# EasyEDA Pro project SciOly_EV_Controller_v1.epro, board PCB1
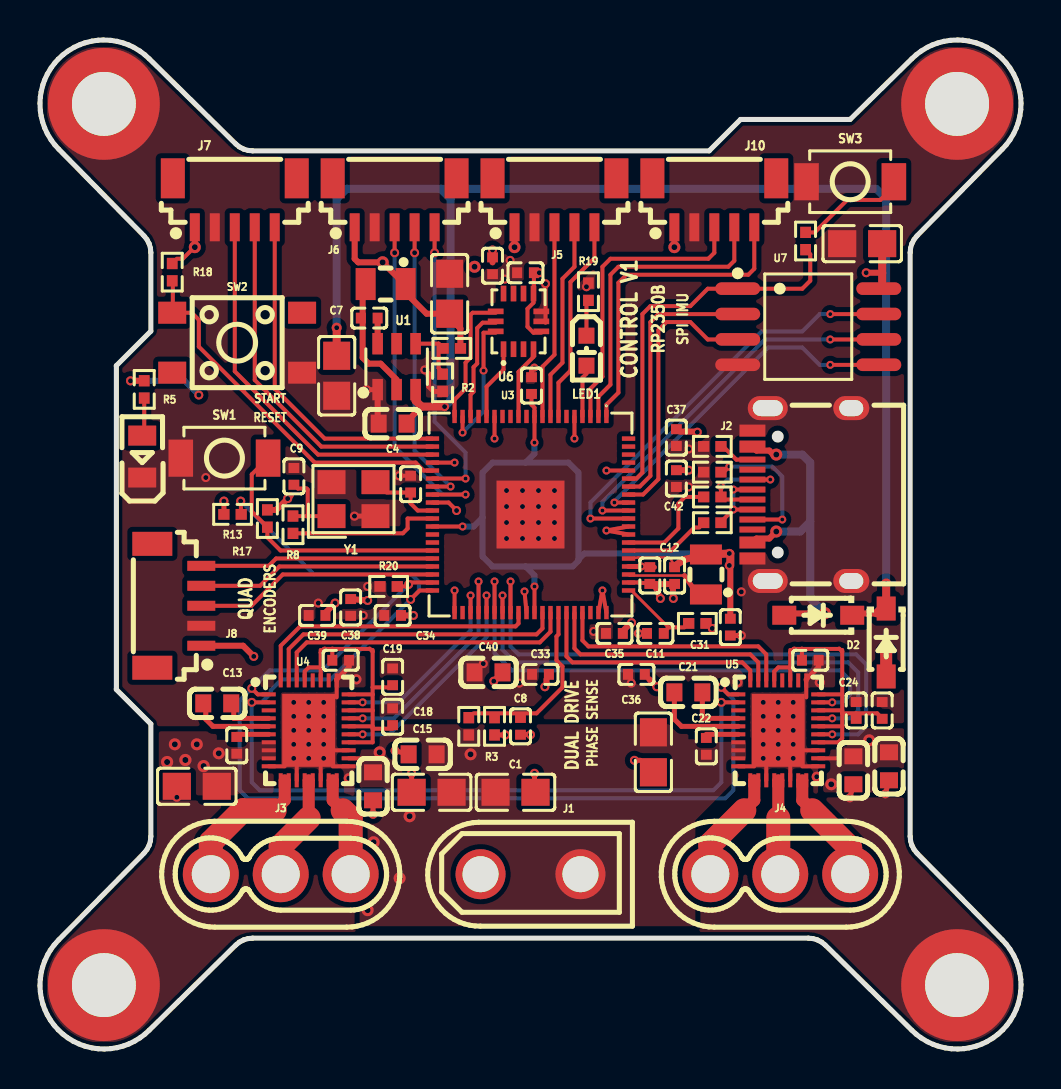
[diagram p4: board, top side]
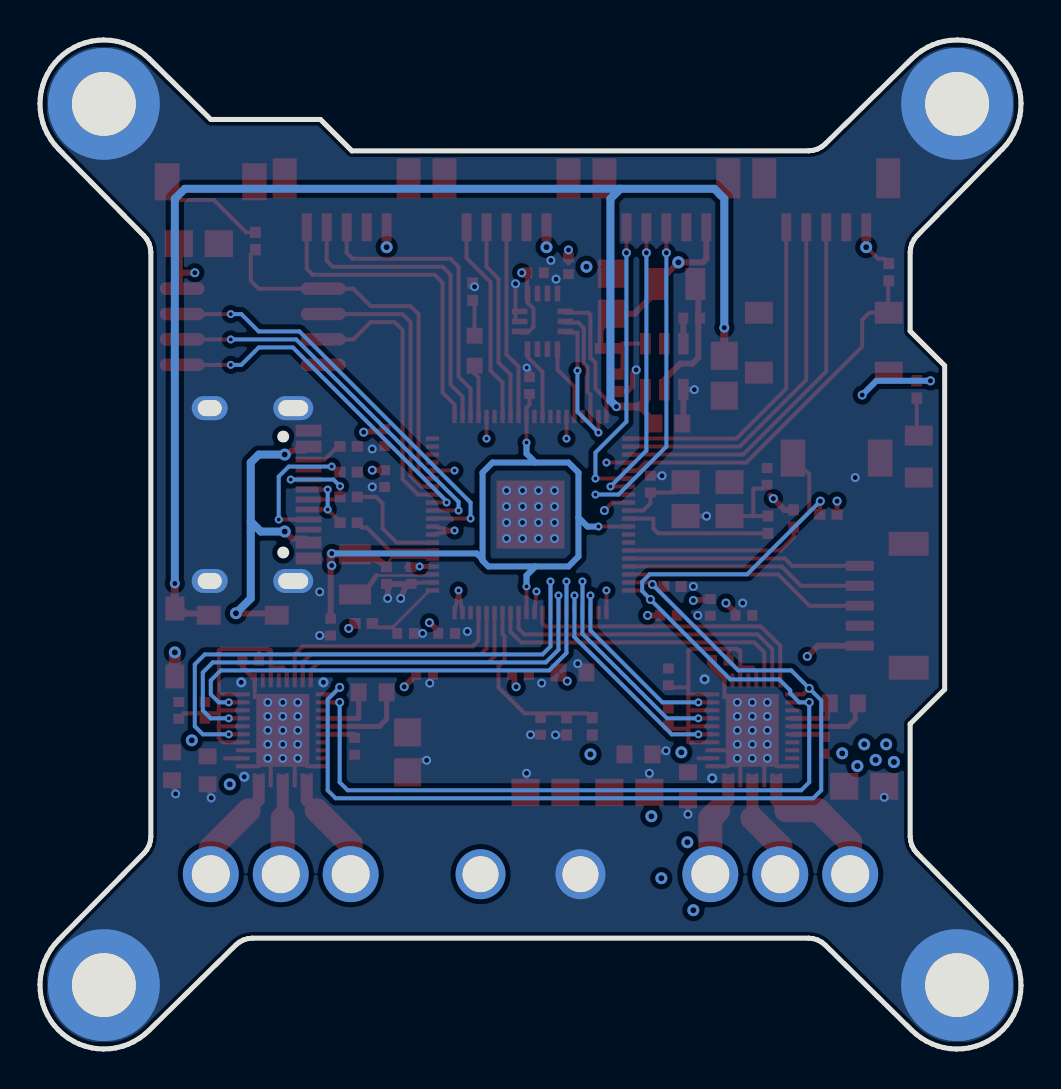
[diagram p5: board, bottom side, seen from below]

Outline 49.1 x 50.5 mm; copper layers: Top Layer, GND_L2, VBAT_SIG, Bottom Layer. Coordinates in mm from the lower left corner of the outline.
Outline path: 0,47.33 0.02,47.64 0.06,47.89 0.15,48.26 0.23,48.5 0.36,48.78 0.56,49.1 0.75,49.35 0.92,49.54 1.15,49.75 1.4,49.94 1.72,50.13 2,50.27 2.24,50.35 2.6,50.44 2.92,50.49 3.17,50.5 3.54,50.48 3.85,50.43 4.16,50.35 4.45,50.24 4.68,50.13 5,49.94 5.25,49.75 5.47,49.55 9.8,45.29 9.98,45.15 10.19,45.04 10.41,44.97 10.64,44.95 33.49,44.95 35.06,46.52 40.54,46.52 43.63,49.55 43.85,49.75 44.1,49.94 44.42,50.13 44.65,50.24 44.94,50.35 45.25,50.43 45.56,50.48 45.93,50.5 46.18,50.49 46.49,50.44 46.86,50.35 47.15,50.24 47.38,50.13 47.7,49.94 47.95,49.75 48.14,49.58 48.35,49.35 48.54,49.1 48.73,48.78 48.87,48.5 48.95,48.26 49.04,47.89 49.09,47.58 49.1,47.33 49.09,47.02 49.04,46.7 48.95,46.34 48.87,46.1 48.73,45.82 48.54,45.5 48.35,45.25 48.15,45.03 43.89,40.7 43.75,40.52 43.64,40.31 43.57,40.09 43.55,39.86 43.55,10.64 43.57,10.41 43.64,10.19 43.75,9.98 43.89,9.8 48.15,5.47 48.35,5.25 48.54,5 48.73,4.68 48.87,4.4 48.95,4.16 49.04,3.79 49.09,3.48 49.1,3.23 49.09,2.92 49.04,2.6 48.95,2.24 48.87,2 48.73,1.72 48.54,1.4 48.39,1.19 48.18,0.96 47.95,0.75 47.7,0.56 47.38,0.36 47.15,0.26 46.86,0.15 46.49,0.06 46.24,0.02 45.93,0 45.62,0.01 45.3,0.06 44.94,0.15 44.7,0.23 44.42,0.36 44.1,0.56 43.85,0.75 43.63,0.95 39.3,5.2 39.12,5.35 38.91,5.46 38.69,5.53 38.46,5.55 10.64,5.55 10.41,5.53 10.19,5.46 9.98,5.35 9.8,5.2 5.47,0.95 5.25,0.75 5,0.56 4.73,0.39 4.45,0.26 4.16,0.15 3.85,0.07 3.54,0.02 3.23,0 2.92,0.01 2.6,0.06 2.24,0.15 1.95,0.26 1.67,0.39 1.4,0.56 1.15,0.75 0.92,0.96 0.71,1.19 0.52,1.45 0.36,1.72 0.26,1.95 0.15,2.24 0.07,2.55 0.02,2.86 0,3.17 0.01,3.48 0.07,3.85 0.13,4.1 0.23,4.4 0.39,4.73 0.52,4.95 0.71,5.21 0.95,5.47 5.2,9.8 5.35,9.98 5.46,10.19 5.53,10.41 5.55,10.64 5.55,16.27 3.82,18 3.82,34.2 5.55,35.93 5.55,39.86 5.53,40.09 5.46,40.31 5.35,40.52 5.2,40.7 0.95,45.03 0.75,45.25 0.56,45.5 0.36,45.82 0.23,46.1 0.13,46.4 0.06,46.7 0.02,46.96 0,47.33
Stack: Top Layer 0.035mm / Dielectric1 1.51mm FR4 er 4.5 / Bottom Layer 0.035mm

## Design rules (mm)
spacing copperThickness1oz (default): track to track 0.1, other pairs 0.1 to 0.3
spacing copperThickness2oz: track to track 0.203, other pairs 0.152 to 0.3
track width copperThickness1oz (default): min 0.1, default 0.2, max 5
track width copperThickness2oz: min 0.203, default 0.254, max 2.54
differential pair differentialPair (default): width min 0.127, default 0.254, max 2.54; gap min 0.152, default 0.152

## Placement (name value [footprint] x y rotation side)
C1  22uF  [C0805]  23.8 12.85 0 top
C2  10uF  [C0805]  19.6 12.85 0 top
C3  10uF  [C0805]  14.85 33.69 90 top
C4  100nF  [C0603]  17.65 31.3 0 top
C5  22uF  [C0805]  20.5 37.8 270 top
C6  22uF  [C0805]  41.15 40.3 0 top
C7  100nF  [C0402]  16.48 36.58 180 top
C8  100nF  [C0402]  24.05 16.15 90 top
C9  15pF  [C0402]  12.71 28.66 270 top
C10  15pF  [C0402]  18.55 28.27 270 top
C11  4.7uF  [C0402]  30.8 20.8 0 top
C12  4.7uF  [C0402]  31.76 23.7 90 top
C13  100nF  [C0603]  8.87 17.3 180 top
C14  1uF  [C0402]  9.85 15.2 270 top
C15  100nF  [C0603]  19.15 14.75 0 top
C16  100nF  [C0603]  16.67 13.15 90 top
C17  10uF  [C0805]  7.85 13.15 0 top
C18  4.7uF  [C0402]  17.65 16.63 90 top
C19  100nF  [C0402]  17.65 18.63 90 top
C21  100nF  [C0603]  32.45 17.85 180 top
C22  1uF  [C0402]  33.35 15.15 270 top
C24  4.7uF  [C0402]  40.85 16.95 90 top
C25  100nF  [C0402]  42.15 16.95 90 top
C26  10uF  [C0805]  30.7 14.85 90 top
C27  100nF  [C0603]  42.49 14.15 90 top
C28  100nF  [C0603]  40.71 13.95 90 top
C29  100nF  [C0402]  24.3 38.85 0 top
C30  100nF  [C0402]  22.65 39.2 90 top
C31  4.7uF  [C0402]  34.55 21.11 90 top
C32  100nF  [C0402]  24.6 33.2 270 top
C33  100nF  [C0402]  25.05 18.75 0 top
C34  100nF  [C0402]  17.65 21.7 0 top
C35  100nF  [C0402]  28.75 20.8 0 top
C36  100nF  [C0402]  29.85 18.75 0 top
C37  100nF  [C0402]  31.85 30.6 90 top
C38  100nF  [C0402]  15.55 22.1 90 top
C39  100nF  [C0402]  13.87 21.7 0 top
C40  10uF  [C0603]  22.45 18.85 0 top
C41  4.7uF  [C0402]  30.52 23.7 90 top
C42  100nF  [C0402]  31.85 28.55 90 top
C43  100nF  [C0402]  15.05 19.46 0 top
C44  100nF  [C0402]  38.55 19.46 0 top
D2  B5819W SL  [SOD-123_L2.7-W1.6-LS3.7-RD-1]  42.35 20.35 270 top
D3  B5819W SL  [SOD-123_L2.7-W1.6-LS3.7-RD-1]  38.95 21.71 180 top
D4  KT-0805G  [LED0805-R-RD]  5.12 29.65 90 top
J1  XT30UPB-M  [CONN-TH_XT30UPB-M]  24.55 8.75 0 top
J2  TYPE-C-31-M-12  [USB-C_SMD-TYPE-C-31-M-12_1]  38.13 27.75 90 top
J3  MR30PB-M.G2.Y  [CONN-TH_MR30PB-M]  12.05 8.75 0 top
J4  MR30PB-M.G2.Y  [CONN-TH_MR30PB-M]  37.05 8.75 0 top
J5  ZX-SH1.0-5PLT  [CONN-SMD_5P-P1.00_ZX-SH1.0-5PLT]  25.75 42.35 0 top
J6  ZX-SH1.0-5PLT  [CONN-SMD_5P-P1.00_ZX-SH1.0-5PLT]  17.75 42.35 0 top
J7  ZX-SH1.0-5PLT  [CONN-SMD_5P-P1.00_ZX-SH1.0-5PLT]  9.75 42.35 0 top
J8  ZX-SH1.0-5PLT  [CONN-SMD_5P-P1.00_ZX-SH1.0-5PLT]  6.85 22.18 90 top
J10  ZX-SH1.0-5PLT  [CONN-SMD_5P-P1.00_ZX-SH1.0-5PLT]  33.75 42.35 0 top
L1  3.3uH  [IND-SMD_L2.0-W1.6_AOTA-B201610S3R3-101-T]  17.3 38.28 0 top
L2  3.3uH  [IND-SMD_L2.0-W1.6_AOTA-B201610S3R3-101-T]  33.33 23.75 270 top
LED1  KT-0603R  [LED-SMD_L1.6-W0.8-R-RD]  27.35 34.95 270 top
NOREF  -  [Pad_e342]  3.2 3.2 0 top
NOREF#2  -  [Pad_e341]  3.2 47.3 0 top
NOREF#3  -  [Pad_e340]  45.9 47.3 0 top
NOREF#4  -  [Pad_e339]  45.9 3.2 0 top
R1  100kΩ  [R0402]  20.61 35.06 0 top
R2  22kΩ  [R0402]  20.15 33.34 90 top
R3  100kΩ  [R0402]  21.46 16.15 270 top
R4  22kΩ  [R0402]  22.75 16.15 90 top
R5  1kΩ  [R0402]  5.22 33.01 90 top
R6  5.1kΩ  [R0402]  33.65 28.87 0 top
R7  5.1kΩ  [R0402]  33.65 30.16 0 top
R8  1kΩ  [R0402]  12.66 26.24 90 top
R9  33Ω  [R0402]  32.9 21.3 0 top
R10  1kΩ  [R0402]  38.31 40.44 270 top
R11  22Ω  [R0402]  33.65 26.34 180 top
R13  10kΩ  [R0402]  9.64 26.76 0 top
R16  22Ω  [R0402]  33.65 27.63 180 top
R17  10kΩ  [R0402]  11.38 26.55 90 top
R18  10kΩ  [R0402]  6.62 38.88 90 top
R19  1kΩ  [R0402]  27.45 37.9 270 top
R20  100kΩ  [R0402]  17.45 23.15 180 top
SW1  TS-1088-AR02016  [SW-SMD_L3.9-W3.0-P4.45]  9.23 29.57 0 top
SW2  KH-4.5X4.5X10H-SMT  [SW-SMD_4P-L4.5-W4.5-P3.00-LS6.8]  9.87 35.35 0 top
SW3  TS-1088-AR02016  [SW-SMD_L3.9-W3.0-P4.45]  40.55 43.4 0 top
U1  TPS54202DDCR  [SOT-23-6_L2.9-W1.6-P0.95-LS2.8-BL]  17.85 34.15 0 top
U3  RP2350B  [QFN-80_L10.0-W10.0-P0.40-TL-EP3.4]  24.55 26.75 270 top
U4  DRV8317HREER  [QFN-36_L5.0-W4.0-P0.40-BL-EP]  13.45 15.95 270 top
U5  DRV8317HREER  [QFN-36_L5.0-W4.0-P0.40-BL-EP]  36.95 15.95 270 top
U6  ICM-42688-P(TOKMAS)  [LGA-14_L3.0-W2.5-P0.50-BL]  23.95 36.42 0 top
U7  W25Q128JVSIQ  [SOIC-8_L5.3-W5.3-P1.27-LS8.0-BL]  38.45 36.15 270 top
Y1  12MHz  [CRYSTAL-SMD_4P-L3.2-W2.5-BL]  15.69 27.52 0 top

## Footprints (pads in the part's own frame, mm; a bottom-side part is the same pattern mirrored in y, then rotated)
C0402
  rect 0.5x0.54 smd: 1(-0.42,0) 2(0.42,0)
C0603
  rect 0.8x0.9 smd: 1(-0.7,0) 2(0.7,0)
C0805
  rect 1.41x1.35 smd: 1(-1,0) 2(1,0)
CONN-SMD_5P-P1.00_ZX-SH1.0-5PLT
  rect 0.5x1.4 smd: 1(-2,-1.225) 2(-1,-1.225) 3(0,-1.225) 4(1,-1.225) 5(2,-1.225)
  rect 1.2x2 smd: 6(3.1,1.225) 7(-3.1,1.225)
CONN-TH_MR30PB-M
  round 2.8 hole 1.9: 1(-3.5,0) 2(0,0) 3(3.5,0)
CONN-TH_XT30UPB-M
  round 2.5 hole 1.8: 1(-2.5,0) 2(2.5,0)
CRYSTAL-SMD_4P-L3.2-W2.5-BL
  rect 1.4x1.2 smd: 1(-1.1,-0.85) 2(1.1,-0.85) 3(1.1,0.85) 4(-1.1,0.85)
IND-SMD_L2.0-W1.6_AOTA-B201610S3R3-101-T
  rect 1x1.6 smd: 1(-1,0) 2(1,0)
LED0805-R-RD
  rect 1x1.399 smd: 1(1.05,0) 2(-1.05,0)
LED-SMD_L1.6-W0.8-R-RD
  rect 0.8x0.8 smd: 1(0.75,0) 2(-0.75,0)
LGA-14_L3.0-W2.5-P0.50-BL
  rect 0.28x0.785 smd: 1(-0.75,-1.393) 2(-0.25,-1.393) 3(0.25,-1.393) 4(0.75,-1.393) 8(0.75,1.393) 9(0.25,1.393) 10(-0.25,1.393) 11(-0.75,1.393)
  rect 0.785x0.28 smd: 5(1.143,-0.5) 6(1.143,0) 7(1.143,0.5) 12(-1.143,0.5) 13(-1.143,0) 14(-1.143,-0.5)
Pad_e339
  round 5.601 hole 3.2: MH1(0,0)
Pad_e340
  round 5.601 hole 3.2: MH2(0,0)
Pad_e341
  round 5.601 hole 3.2: MH3(0,0)
Pad_e342
  round 5.601 hole 3.2: MH4(0,0)
QFN-36_L5.0-W4.0-P0.40-BL-EP
  rect 0.2x0.7 smd: 1(-1.8,-2) 2(-1.4,-2) 3(-1,-2) 4(-0.6,-2) 5(-0.2,-2) 6(0.2,-2) 7(0.6,-2) 8(1,-2) 9(1.4,-2) 10(1.8,-2) 19(1.8,2) 20(1.4,2) 21(1,2) 22(0.6,2) 23(0.2,2) 24(-0.2,2) 25(-0.6,2) 26(-1,2) 27(-1.4,2) 28(-1.8,2)
  rect 0.7x0.2 smd: 11(2.5,-1.4) 12(2.5,-1) 13(2.5,-0.6) 14(2.5,-0.2) 15(2.5,0.2) 16(2.5,0.6) 17(2.5,1) 18(2.5,1.4) 29(-2.5,1.4) 30(-2.5,1) 31(-2.5,0.6) 32(-2.5,0.2) 33(-2.5,-0.2) 34(-2.5,-0.6) 35(-2.5,-1) 36(-2.5,-1.4)
  rect 3.65x2.65 smd: 37(0,0)
QFN-80_L10.0-W10.0-P0.40-TL-EP3.4
  rect 0.665x0.22 smd: 1(-4.907,3.8) 2(-4.907,3.4) 3(-4.907,3) 4(-4.907,2.6) 5(-4.907,2.2) 6(-4.907,1.8) 7(-4.907,1.4) 8(-4.907,1) 9(-4.907,0.6) 10(-4.907,0.2) 11(-4.907,-0.2) 12(-4.907,-0.6) 13(-4.907,-1) 14(-4.907,-1.4) 15(-4.907,-1.8) 16(-4.907,-2.2) 17(-4.907,-2.6) 18(-4.907,-3) 19(-4.907,-3.4) 20(-4.907,-3.8) 41(4.907,-3.8) 42(4.907,-3.4) 43(4.907,-3) 44(4.907,-2.6) 45(4.907,-2.2) 46(4.907,-1.8) 47(4.907,-1.4) 48(4.907,-1) 49(4.907,-0.6) 50(4.907,-0.2) 51(4.907,0.2) 52(4.907,0.6) 53(4.907,1) 54(4.907,1.4) 55(4.907,1.8) 56(4.907,2.2) 57(4.907,2.6) 58(4.907,3) 59(4.907,3.4) 60(4.907,3.8)
  rect 0.22x0.665 smd: 21(-3.8,-4.907) 22(-3.4,-4.907) 23(-3,-4.907) 24(-2.6,-4.907) 25(-2.2,-4.907) 26(-1.8,-4.907) 27(-1.4,-4.907) 28(-1,-4.907) 29(-0.6,-4.907) 30(-0.2,-4.907) 31(0.2,-4.907) 32(0.6,-4.907) 33(1,-4.907) 34(1.4,-4.907) 35(1.8,-4.907) 36(2.2,-4.907) 37(2.6,-4.907) 38(3,-4.907) 39(3.4,-4.907) 40(3.8,-4.907) 61(3.8,4.907) 62(3.4,4.907) 63(3,4.907) 64(2.6,4.907) 65(2.2,4.907) 66(1.8,4.907) 67(1.4,4.907) 68(1,4.907) 69(0.6,4.907) 70(0.2,4.907) 71(-0.2,4.907) 72(-0.6,4.907) 73(-1,4.907) 74(-1.4,4.907) 75(-1.8,4.907) 76(-2.2,4.907) 77(-2.6,4.907) 78(-3,4.907) 79(-3.4,4.907) 80(-3.8,4.907)
  rect 3.4x3.4 smd: 81(0,0)
R0402
  rect 0.566x0.54 smd: 1(-0.433,0) 2(0.433,0)
SOD-123_L2.7-W1.6-LS3.7-RD-1
  rect 1.2x0.95 smd: 1(-1.7,0) 2(1.7,0)
SOIC-8_L5.3-W5.3-P1.27-LS8.0-BL
  oval 0.63x2.25 smd: 1(-1.905,-3.53) 2(-0.635,-3.53) 3(0.635,-3.53) 4(1.905,-3.53) 5(1.905,3.53) 6(0.635,3.53) 7(-0.635,3.53) 8(-1.905,3.53)
SOT-23-6_L2.9-W1.6-P0.95-LS2.8-BL
  rect 0.532x1.072 smd: 1(-0.95,-1.149) 2(0,-1.149) 3(0.95,-1.149) 4(0.95,1.149) 5(0,1.149) 6(-0.95,1.149)
SW-SMD_4P-L4.5-W4.5-P3.00-LS6.8
  rect 1.4x1.1 smd: 1(-3.25,1.5) 2(3.25,1.5) 3(-3.25,-1.5) 4(3.25,-1.5)
SW-SMD_L3.9-W3.0-P4.45
  rect 1.23x1.86 smd: 1(-2.185,0) 2(2.185,0)
USB-C_SMD-TYPE-C-31-M-12_1
  oval 1.2x2 hole 0.8x1.5: 1(4.325,1.706) 4(-4.325,1.706)
  oval 1.2x1.8 hole 0.8x1.2: 2(4.325,-2.474) 3(-4.325,-2.474)
  custom 0.6x1.3 smd: A1B12(-3.2,2.474) A4B9(-2.4,2.474) B1A12(3.2,2.474) B4A9(2.401,2.474)
  rect 0.3x1.3 smd: A5(-1.25,2.474) A6(-0.25,2.474) A7(0.25,2.474) A8(1.25,2.474) B5(1.75,2.474) B6(0.75,2.474) B7(-0.75,2.474) B8(-1.75,2.474)

## Nets
As in the schematic, except:
GND: C1.2 C2.1 C3.1 C4.1 C5.1 C6.1 C8.1 C9.1 C10.1 C11.1 C12.1 C15.1 C16.1 C17.1 C18.2 C19.2 C24.2 C25.2 C26.1 C27.1 C28.1 C29.1 C30.1 C31.1 C32.1 C33.1 C34.1 C35.1 C36.1 C37.1 C38.1 C39.1 C40.1 C41.1 C42.1 C43.2 C44.2 D4.2 J1.1 J2.1 J2.2 J2.3 J2.4 J2.A1B12 J2.B1A12 J5.2 J6.2 J7.2 J8.2 J10.2 NOREF.MH4 NOREF#2.MH3 NOREF#3.MH2 NOREF#4.MH1 R2.1 R4.1 R6.1 R7.1 R19.1 R20.2 SW1.1 SW2.4 SW3.1 U1.1 U3.62 U3.81 U4.10 U4.13 U4.16 U4.19 U4.21 U4.29 U4.37 U5.10 U5.13 U5.16 U5.19 U5.21 U5.29 U5.37 U6.6 U6.7 U7.4 Y1.2 Y1.4

Pads without a net: J2 A8 B8; J5 6 7; J6 6 7; J7 6 7; J8 6 7; J10 6 7; SW2 2 3; U1 5; U3 6 11 13 14 17 33 34 42 58 77 78 79 80; U4 3 30 32; U5 3 30 32; U6 2 3 9 10 11

## Via types
v1: diameter 0.45, hole 0.25, Top Layer to Bottom Layer, 102 vias
v2: diameter 0.508, hole 0.254, Top Layer to Bottom Layer, 5 vias
v3: diameter 0.457, hole 0.254, Top Layer to Bottom Layer, 7 vias
v4: diameter 0.406, hole 0.203, Top Layer to Bottom Layer, 1 via
v5: diameter 0.6, hole 0.3, Top Layer to Bottom Layer, 19 vias
v6: diameter 0.61, hole 0.305, Top Layer to Bottom Layer, 4 vias
v7: diameter 0.5, hole 0.25, Top Layer to Bottom Layer, 2 vias
v8: diameter 0.4, hole 0.2, Top Layer to Bottom Layer, 41 vias
v9: diameter 0.46, hole 0.25, Top Layer to Bottom Layer, 2 vias

## Routing (per net, layer and track width the routed paths; a pad name or vN(x,y) marks a point on that pad's centre or on a via; arc(x,y) is an arc through that point)
+1V1: length 44.2
  Top Layer w0.12: 31.67,24.35 31.5,24.6 29.95,24.6 29.46,24.55
  Top Layer w0.2: U3.32 v8(21.15,26.15) ; U3.10 v8(24.75,30.35) ; U3.51 v8(24.75,23.15) ; 24.6,32.83 24.6,32.25 24.75,32.1 24.75,31.66
  Top Layer w0.3: 34.55,24.2 C31.2
  Top Layer w0.35: 31.67,24.11 32.25,24.5 L2.1
  Top Layer w0.4: 34.55,24.2 34.55,24.8 L2.1
  Bottom Layer w0.3: 24.3,24.15 24.75,23.7 v8(24.75,23.15) ; 24.3,24.15 26.66,24.15 26.95,24.44 26.95,24.51 ; 24.3,24.15 22.65,24.15 22.15,24.65 22.15,26.6 ; 26.95,24.51 26.95,28.85 26.45,29.35 24.3,29.35 ; 26.95,24.51 27.24,24.8 34.55,24.8 ; v8(21.15,26.15) 21.7,26.15 22.15,26.6 ; 24.3,29.35 24.75,29.8 v8(24.75,30.35) ; 24.3,29.35 22.65,29.35 22.15,28.85 22.15,26.6
  vias: v9(34.5,24.8) v9(34.5,24.2)
+3V3: length 49.5
  Top Layer w0.2: v1(20.85,26.95) 20.45,27.35 19.64,27.35 ; U3.24 v8(20.75,29.35) ; 6.85,39.55 7.15,39.55 7.75,40.15 ; 29.46,28.95 v8(28.35,28.95) ; 24.7,37.74 24.7,37.35 24.4,37.05 24.4,36.15 24.7,35.85 25.09,35.85 ; U3.50 v8(24.25,22.9) ; 24.7,37.74 24.72,37.76 C29.2 ; U3.60 v8(28.15,22.95) U3.59 ; U3.5 v8(26.75,30.55) ; 29.46,26.15 v8(28.35,25.95) 29.46,25.75 ; U3.15 v8(22.75,30.55) ; U3.41 v8(20.75,22.95)
  Top Layer w0.25: 9.21,26.76 v3(9.21,27.42) ; 30.75,24.11 v8(30.1,24.15) 29.46,24.15 ; v1(33.65,21.05) 33.55,21.15
  Top Layer w0.299: 20.3,36.8 19.35,36.8 18.3,37.85
  Top Layer w0.3: 5.22,33.44 v3(4.53,33.44) ; v1(41.35,38.85) 42.15,38.85 ; 32.9,30.85 32.85,30.9 32.05,30.9 ; v5(7.75,40.13) 7.75,41.13 ; 15.75,41.13 15.75,39.55 15.93,39.37 v6(17.15,39.37) 17.97,38.55 ; 20.3,36.8 21.04,36.06 21.04,35.06 ; 8.08,20.18 10.17,20.18 v1(10.7,19.65) ; v1(14.77,22.32) 14.29,21.84 C39.2 ; 30.85,18.15 30.5,18.5 ; v1(22.65,39.99) C30.2 22.65,39.37 ; 25.25,18.15 25.35,18.25 25.35,18.5 ; C40.2 v1(22.71,18.41) ; 11.38,26.98 11.83,26.98 12.55,27.7 ; 31.75,41.13 v5(31.75,40.13) ; C42.2 v1(32.47,28.97) ; C38.2 v1(16.4,22.45) ; v1(24.99,38.85) C29.2 ; 23.75,41.13 v5(23.75,40.13) ; 29.6,21.35 29.25,21 ; C34.2 v1(18.69,21.7)
  Top Layer w0.4: C6.2 42.15,38.05
  Bottom Layer w0.3: v1(7.95,32.73) 7.24,33.44 v3(4.53,33.44)
  vias: v1(25.27,18.13) v1(29.61,21.34) v1(30.87,18.13) v1(32.9,30.87) v3(12.4,27.55) v5(21.75,39.15)
GND: length 29.3
  Top Layer w0.2: 30.75,23.27 29.95,23.35 29.46,23.35 ; U5.13 36.35,14.2 ; U4.16 14.05,14.2 ; C10.1 v3(17.97,28.69) ; U5.19 38.15,14.15 ; U4.19 14.65,14.15 ; U4.21 14.65,14.95 ; 25.3,36.35 v1(25.3,38.3) ; U5.29 38.35,17.6 ; U4.13 12.85,14.2 ; U4.10 12.25,14.15 ; U5.10 35.75,14.15 ; U4.29 14.85,17.6 ; U5.16 37.55,14.2 ; U5.21 38.15,14.95
  Top Layer w0.25: C31.1 v3(35.1,20.69) ; C27.1 v1(42.31,12.77) ; C44.2 38.97,19.12 38.35,18.5 U5.29 ; Y1.2 v3(15.74,26.67) ; 24.55,15.75 24.3,15.75 ; C16.1 v1(16.67,11.75) ; 22.75,15.72 v1(23.3,15.72) ; v1(29.95,20.8) 30.2,20.8 ; 20.15,32.91 19.7,32.91 19.45,33.16 19.45,33.8 19.25,34 ; C15.1 v1(17.77,14.93) ; 16.9,33 v1(16.35,33) ; C43.2 15.47,19.12 14.85,18.5 U4.29 ; v1(29.75,14.45) 30.05,14.45 ; v4(24.74,34.1) 24.6,33.96 24.6,33.67 ; v1(24.75,13.8) 24.75,13.5 ; C28.1 v1(40.53,12.57) ; 18.6,12.85 v1(18.6,13.8)
  Top Layer w0.3: v1(31.7,22.55) 31.67,23.27 30.75,23.27 v1(31.05,22.55) ; 16.9,33 16.9,31.7
  vias: v1(6.85,12.6) v1(8.3,28.6) v1(12.7,17.35) v1(12.7,16.65) v1(12.7,15.95) v1(12.7,15.25) v1(12.7,14.55) v1(13.45,17.35) v1(13.45,16.65) v1(13.45,15.95) v1(13.45,15.25) v1(13.45,14.55) v1(13.93,22.32) v1(14.2,17.35) v1(14.2,16.65) v1(14.2,15.95) v1(14.2,15.25) v1(14.2,14.55) v1(16.18,21.7) v1(16.4,23.15) v1(19.26,33.99) v1(22.19,19.29) v1(23.27,38.53) v1(23.35,27.95) v1(23.35,27.15) v1(23.35,26.35) v1(23.35,25.55) v1(23.53,39.47) v1(23.99,18.31) v1(24.15,27.95) v1(24.15,27.15) v1(24.15,26.35) v1(24.15,25.55) v1(24.55,15.73) v1(24.95,27.95) v1(24.95,27.15) v1(24.95,26.35) v1(24.95,25.55) v1(25.75,27.95) v1(25.75,27.15) v1(25.75,26.35) v1(25.75,25.55) v1(27.35,38.15) v1(27.71,20.9) v1(29.59,18.31) v1(32.47,30.03) v1(32.47,28.13) v1(35.1,22.88) v1(36.2,17.35) v1(36.2,16.65) v1(36.2,15.95) v1(36.2,15.25) v1(36.2,14.55) v1(36.95,17.35) v1(36.95,16.65) v1(36.95,15.95) v1(36.95,15.25) v1(36.95,14.55) v1(37.7,17.35) v1(37.7,16.65) v1(37.7,15.95) v1(37.7,15.25) v1(37.7,14.55) v2(15.46,13.55) v2(15.84,18.5) v2(34.91,18.35) v2(38.87,13.63) v2(39.03,18.35)
VBAT: length 2.5
  Top Layer w0.2: U4.20 16.15,14.55 ; U5.20 39.85,14.55
  Top Layer w0.6: 42.35,18.9 v5(42.35,19.85)
  vias: v5(6.75,15.25) v5(7.85,15.25) v5(8.95,14.8) v5(16.4,6.95) v5(16.7,10.35) v5(17,14.85) v5(18,8.55) v5(18.5,11.65) v5(21.55,14.75) v5(39.6,13.25) v5(41.5,15.45) v6(6.36,14.36) v6(7.28,14.46) v6(8.19,14.16)
VBAT_SENSE: length 8.6
  Top Layer w0.2: 25.95,21.55 25.95,20.75 25.85,20.65 25.85,19.45 26.15,19.15 26.15,18.1 24.85,16.8 21.7,16.8
VBUS: length 15.9
  Top Layer w0.3: v5(36.85,29.75) 36.7,29.75 36.5,29.95 35.86,29.95 35.66,30.15 ; v5(36.85,25.9) 36.5,25.55 35.86,25.55 35.66,25.35 ; 39.3,21.8 37.8,21.8
  Bottom Layer w0.4: v5(39.29,21.81) 38.55,22.55 38.55,26.4 ; 38.55,26.4 38.05,25.9 v5(36.85,25.9) ; 38.55,26.4 38.55,29.35 38.15,29.75 v5(36.85,29.75)
BUCK_SW: length 5.3
  Top Layer w0.3: 16.15,37.73 16.15,34.6 16.45,34.3 17.05,34.3 17.85,33.5
DRV1_AVDD: length 17.5
  Top Layer w0.2: 16.65,17.75 16.65,18.1 ; 16.65,17.75 16.65,16.95 ; 16.65,17.75 U4.28 ; 16.65,18.1 16.65,19.89 ; 16.65,18.1 17.45,18.1 ; U4.24 16.65,16.15 ; 16.65,16.15 16.65,16.95 ; 16.65,16.15 16.65,16.03 ; U4.22 16.65,15.35 16.65,16.03 ; 16.65,16.03 17.65,16.03 ; 16.65,19.89 16.5,20.04 ; 16.65,19.89 16.65,19.97 ; 16.65,16.95 U4.26 ; 14.63,20.02 C43.1 ; 14.63,20.02 14.23,20.02 ; 14.63,20.02 16.5,20.02 ; 14.63,20.02 14.63,20.04 ; U4.33 13.25,18.9 13.45,19.1 14.05,19.1 ; 14.23,20.02 14.25,20.04 ; 14.23,20.02 14.05,19.84 ; 14.23,20.02 14.2,20.02 ; 14.05,19.1 U4.31 ; 14.05,19.1 14.05,19.84 ; 14.05,19.84 14.05,19.97
DRV1_CP: length 1.6
  Top Layer w0.25: U4.6 9.85,15.75
DRV1_CPH: length 4.1
  Top Layer w0.25: 8.3,17.3 8.3,16.5 8.65,16.15 U4.5
DRV1_CPL: length 2.5
  Top Layer w0.25: 9.7,17.3 9.7,16.55 U4.4
DRV2_AVDD: length 17.9
  Top Layer w0.2: U5.33 36.75,18.9 36.95,19.1 37.55,19.1 ; 40,20.02 38.13,20.02 ; 38.13,20.02 37.73,20.02 ; 38.13,20.02 38.13,20.04 ; 38.13,20.02 C44.1 ; 37.73,20.02 37.75,20.04 ; 37.73,20.02 37.7,20.02 ; 37.73,20.02 37.55,19.84 ; U5.28 40.15,17.75 ; 40.15,17.75 40.15,19.89 ; 40.15,17.75 40.15,16.95 ; U5.24 40.15,16.15 ; 40.15,16.15 40.15,15.55 39.95,15.35 U5.22 ; 40.15,16.15 40.15,16.8 ; 40,20.04 40.15,19.89 ; 40.15,19.89 40.15,19.97 ; 42.15,16.55 41.9,16.8 40.85,16.8 ; 37.55,19.1 U5.31 ; 37.55,19.1 37.55,19.84 ; 40.15,16.8 40.15,16.95 ; 40.15,16.8 40.85,16.8 ; 40.15,16.95 U5.26 ; 37.55,19.84 37.55,19.97 ; 40.85,16.8 C24.1
DRV2_CP: length 1.6
  Top Layer w0.25: U5.6 33.35,15.75
DRV2_CPH: length 4.7
  Top Layer w0.25: C21.2 31.75,16.5 32.1,16.15 U5.5
DRV2_CPL: length 3.1
  Top Layer w0.25: U5.4 33.15,16.55 C21.1
DRV_NFAULT: length 57.4
  Top Layer w0.2: 18.5,22.45 v1(18.55,22.5) 19,22.95 19.64,22.95 ; U5.2 v1(34.1,17.35) ; 10.07,26.76 v3(10.05,27.42) ; U4.2 v1(10.6,17.35)
  Bottom Layer w0.2: v1(34.1,17.35) 34.1,13.35 33.7,12.95 11,12.95 10.6,13.35 v1(10.6,17.35) 11.1,17.35 11.55,17.8 11.55,17.95 12.1,18.5 14.55,18.5 18.5,22.45 ; v3(10.05,27.42) 13.7,23.76 18.58,23.76 18.96,23.38 18.96,22.92 18.5,22.45 v1(18.55,22.5)
DRV_NSLEEP: length 49.6
  Top Layer w0.2: v1(34.1,18.1) 34.45,17.75 U5.1 ; 19.64,23.35 18.55,23.35 v1(18.45,23.25) 18.35,23.15 17.88,23.15 ; U4.1 10.9,17.75 v1(10.6,18.05)
  Bottom Layer w0.2: v1(34.1,18.1) 34.7,17.5 34.7,12.95 34.3,12.55 10.4,12.55 10,12.95 10,17.45 v1(10.6,18.05) 11.5,18.95 14.15,18.95 v1(18.45,23.25)
EXP_IO: length 14.9
  Top Layer w0.2: 33.75,41.13 33.75,39.85 33.45,39.55 28.55,39.55 28.15,39.15 28.15,33.65 27.55,33.05 27.55,31.66
EXP_RX: length 15.5
  Top Layer w0.2: 27.95,31.66 27.95,32.65 28.55,33.25 28.55,38.75 28.95,39.15 34.45,39.15 34.75,39.45 34.75,41.13
EXP_TX: length 16.1
  Top Layer w0.2: 35.75,41.13 35.75,39.05 35.45,38.75 29.35,38.75 28.95,38.35 28.95,32.85 28.35,32.25 28.35,31.66
IMU_CS: length 6.7
  Top Layer w0.2: 22.81,36.85 21.65,36.85 21.55,36.75 21.55,34.6 21.3,34.35 21.3,33.05 20.75,32.5 20.75,31.66
IMU_INT1: length 3.6
  Top Layer w0.2: 23.95,31.66 23.95,33.89 24.7,34.64 24.7,34.96
M1_A: length 7.6
  Top Layer w0.2: U4.11 U4.12
  Top Layer w0.6: 12.25,13.45 12.25,12.45 11.75,11.95
  Top Layer w1.2: J3.1 8.55,10.35 10.15,11.95 11.75,11.95
M1_B: length 5.7
  Top Layer w0.2: U4.14 U4.15
  Top Layer w0.6: 13.45,13.45 13.45,11.55
  Top Layer w1.2: 13.45,11.55 12.05,10.15 J3.2
M1_C: length 5.5
  Top Layer w0.2: U4.17 U4.18
  Top Layer w0.6: 14.65,13.45 14.65,12.45 15.15,11.95
  Top Layer w1.2: 15.15,11.95 15.55,11.55 J3.3
M1_ENC_A: length 9.7
  Top Layer w0.2: 25.15,31.66 25.15,34.15 25.75,34.75 25.75,41.13
M1_ENC_B: length 10
  Top Layer w0.2: 25.55,31.66 25.55,33.75 26.15,34.35 26.15,38.55 26.75,39.15 26.75,41.13
M1_ENC_Z: length 10.2
  Top Layer w0.2: 27.75,41.13 27.75,39.58 26.55,38.38 26.55,33.95 25.95,33.35 25.95,31.66
M1_INA: length 11.9
  Top Layer w0.2: U4.23 v8(16.15,15.75) ; 22.35,21.84 v8(22.35,22.7)
  Bottom Layer w0.2: v8(22.35,22.7) 22.35,20.62 17.48,15.75 v8(16.15,15.75)
M1_INB: length 12.4
  Top Layer w0.2: 21.95,21.84 v8(21.95,23.4) ; U4.25 v8(16.15,16.55)
  Bottom Layer w0.2: v8(16.15,16.55) 17.72,16.55 21.95,20.78 v8(21.95,23.4)
M1_INC: length 10.2
  Top Layer w0.2: U4.27 v8(16.15,17.35) ; 21.55,21.84 v8(21.55,22.7)
  Bottom Layer w0.2: v8(21.55,22.7) 21.55,20.95 17.95,17.35 v8(16.15,17.35)
M1_SOA: length 14.6
  Top Layer w0.2: U4.36 12.05,20.18 13.02,21.15 23.8,21.15 23.95,21.3 23.95,21.84
M1_SOB: length 15.5
  Top Layer w0.2: U4.35 12.45,20.02 13.18,20.75 24.85,20.75 25.15,21.05 25.15,21.84
M1_SOC: length 15.5
  Top Layer w0.2: U4.34 12.85,19.85 13.35,20.35 25.02,20.35 25.55,20.88 25.55,21.84
M2_A: length 6
  Top Layer w0.2: U5.12 U5.11
  Top Layer w0.6: 35.75,13.45 35.75,12.45 35.25,11.95
  Top Layer w1.2: J4.1 33.55,10.25 35.25,11.95
M2_B: length 5.1
  Top Layer w0.2: U5.14 U5.15
  Top Layer w0.6: 36.95,13.45 36.95,11.55
  Top Layer w1.2: 36.95,11.55 36.95,8.75
M2_C: length 6.1
  Top Layer w0.2: U5.17 U5.18
  Top Layer w0.6: 38.65,11.95 38.15,12.45 38.15,13.45
  Top Layer w1.2: J4.3 40.55,10.05 38.65,11.95
M2_ENC_A: length 17.2
  Top Layer w0.2: 17.75,41.13 v1(17.75,39.85) ; 19.64,27.75 v8(21.3,27.75)
  Bottom Layer w0.2: v1(17.75,39.85) 17.75,30.15 20.15,27.75 v8(21.3,27.75)
M2_ENC_B: length 14.6
  Top Layer w0.2: 19.64,28.15 v8(20.55,28.15) ; 18.75,41.13 v1(18.75,39.85)
  Bottom Layer w0.2: v8(20.55,28.15) 18.75,29.95 v1(18.75,39.85)
M2_ENC_Z: length 14.9
  Top Layer w0.2: 19.64,28.55 v8(21.3,28.55) ; 19.75,41.13 v1(19.75,39.85)
  Bottom Layer w0.2: v1(19.75,39.85) 19.75,31.4 21.3,29.85 v8(21.3,28.55)
M2_INA: length 28.6
  Top Layer w0.2: 23.55,21.84 v8(23.55,23.4) ; U5.23 v8(39.65,15.75)
  Bottom Layer w0.2: v8(23.55,23.4) 23.55,20.15 23.95,19.75 40.85,19.75 41.35,19.25 41.35,16.15 40.95,15.75 v8(39.65,15.75)
M2_INB: length 25.9
  Top Layer w0.2: U5.25 v8(39.65,16.55) ; 23.15,21.84 v8(23.15,22.7)
  Bottom Layer w0.2: v8(23.15,22.7) 23.15,19.98 23.78,19.35 40.45,19.35 40.95,18.85 40.95,16.95 40.55,16.55 v8(39.65,16.55)
M2_INC: length 26
  Top Layer w0.2: U5.27 v8(39.65,17.35) ; 22.75,21.84 v8(22.75,23.4)
  Bottom Layer w0.2: v8(39.65,17.35) 40.15,17.35 40.55,17.75 40.55,18.45 40.05,18.95 23.62,18.95 22.75,19.82 v8(22.75,23.4)
M2_SOA: length 12.2
  Top Layer w0.2: 26.35,21.84 26.35,19.65 26.65,19.35 35.15,19.35 35.55,18.95 U5.36
M2_SOB: length 12.2
  Top Layer w0.2: U5.35 35.95,19.35 35.55,19.75 27.05,19.75 26.75,20.05 26.75,21.84
M2_SOC: length 12.2
  Top Layer w0.2: U5.34 36.35,19.75 35.95,20.15 27.45,20.15 27.15,20.45 27.15,21.84
ODO1_A: length 18.8
  Top Layer w0.2: 19.64,29.75 13.92,29.75 9.75,33.92 9.75,41.13
ODO1_B: length 17.9
  Top Layer w0.2: 10.75,41.13 10.75,33.48 14.08,30.15 19.64,30.15
ODO1_Z: length 17
  Top Layer w0.2: 19.64,30.55 14.25,30.55 11.75,33.05 11.75,41.13
ODO2_A: length 12.2
  Top Layer w0.2: 8.08,22.18 10.58,22.18 12.15,23.75 19.64,23.75
ODO2_B: length 12
  Top Layer w0.2: 8.08,23.18 11.02,23.18 11.98,24.15 19.64,24.15
ODO2_Z: length 11.7
  Top Layer w0.2: 19.64,24.55 11.82,24.55 11.45,24.18 8.08,24.18
QSPI_SCLK: length 18.9
  Top Layer w0.2: v8(39.55,35.51) 41.98,35.51 ; 29.46,26.95 v8(28.15,26.95)
  Bottom Layer w0.2: v8(28.15,26.95) 28.15,27.38 36.28,35.51 v8(39.55,35.51)
QSPI_SD0: length 17.6
  Top Layer w0.2: 29.46,27.35 v8(28.75,27.35) ; v8(39.55,34.24) 41.98,34.24
  Bottom Layer w0.2: v8(39.55,34.24) 39.02,34.24 38.15,35.11 36.44,35.11 28.75,27.42 v8(28.75,27.35)
QSPI_SD1: length 13.5
  Top Layer w0.2: 34.92,36.78 30.95,36.78 30.55,36.38 30.55,28.68 30.02,28.15 29.46,28.15
QSPI_SD2: length 13.8
  Top Layer w0.2: 34.92,35.51 33.42,35.51 32.55,36.38 31.35,36.38 30.95,35.98 30.95,28.52 30.18,27.75 29.46,27.75
QSPI_SD3: length 21
  Top Layer w0.2: v8(39.55,36.78) 41.98,36.78 ; 29.46,26.55 v8(27.55,26.55)
  Bottom Layer w0.2: v8(27.55,26.55) 27.55,27.35 36.11,35.91 38.15,35.91 39.02,36.78 v8(39.55,36.78)
QSPI_SS: length 19.5
  Top Layer w0.2: 29.46,28.55 29.85,28.55 30.15,28.85 30.15,36.78 30.55,37.18 32.55,37.18 33.42,38.05 38.15,38.05 38.55,38.45 38.55,39.77 38.31,40.01
SPI_MISO: length 3.7
  Top Layer w0.2: 22.35,31.66 22.35,33.15 23.2,34 23.2,34.96
SPI_MOSI: length 6.9
  Top Layer w0.2: 21.15,31.66 v8(21.15,30.85) ; v8(22.2,33.95) 22.2,35.85 22.81,35.85
  Bottom Layer w0.2: v8(21.15,30.85) 22.2,31.9 v8(22.2,33.95)
SPI_SCK: length 5.6
  Top Layer w0.2: 22.81,36.35 22.15,36.35 21.88,36.08 21.88,34.31 21.7,34.12 21.7,32.9 21.55,32.75 21.55,31.66
START_BTN: length 18.4
  Top Layer w0.2: 6.65,36.85 7.59,36.85 7.95,36.49 7.95,35.15 13.75,29.35 18.8,29.35 19.2,28.95 19.64,28.95 ; 6.65,36.85 6.65,38.2 ; 6.65,36.85 SW2.1
STATUS_LED: length 2.6
  Top Layer w0.2: LED1.1 27.35,33.8 27.15,33.6 27.15,31.66
USB_DN: length 3.6
  Top Layer w0.2: v8(34.7,28) 35.66,28 ; 35.66,27 v8(34.7,27) 34.25,26.55
  Bottom Layer w0.2: v8(34.7,27) v8(34.7,28)
USB_DP: length 5.6
  Top Layer w0.2: 34.08,27.5 35.66,27.5 ; v8(34.08,28.17) 34.08,27.63 ; 35.66,28.5 v8(36.55,28.5)
  Bottom Layer w0.2: v8(36.55,28.5) 34.41,28.5 v8(34.08,28.17)
VSYS: length 71
  Top Layer w0.3: 19.1,32.15 18.65,31.7 ; 41.85,21.8 41.2,21.8
  Top Layer w0.4: 18.8,33 18.8,32.45 19.1,32.15 v1(20.25,32.15) ; v7(42.35,23.3) 42.35,22.3 41.86,21.81 ; 14.85,35.05 v7(14.85,36.1)
  Bottom Layer w0.4: 20.05,43.05 15.35,43.05 14.85,42.55 v7(14.85,36.1) ; 20.05,43.05 20.55,42.55 20.55,32.45 v1(20.25,32.15) ; 20.05,43.05 41.85,43.05 42.35,42.55 v7(42.35,23.3)
XIN: length 3
  Top Layer w0.2: 19.64,26.95 18.9,26.95 18.55,27.3 C10.2 17.35,27.85
XOUT: length 7.6
  Top Layer w0.2: 12.66,25.81 18.16,25.81 18.4,26.05 18.4,26.55 19.64,26.55
$1N59: length 1.3
  Top Layer w0.3: 16.9,35.3 C7.1
$1N62: length 3
  Top Layer w0.2: 19.95,35.3 20.18,35.07 ; 19.95,35.3 18.8,35.3 ; 19.95,35.3 19.95,34.07 20.15,33.87
$1N64: length 7
  Top Layer w0.2: 34.08,28.87 34.22,28.87 v8(34.5,29.15) ; 35.66,26.5 v8(37.15,26.5)
  Bottom Layer w0.2: v8(34.5,29.15) 36.65,29.15 37.15,28.65 v8(37.15,26.5)
$1N65: length 1
  Top Layer w0.2: 35.05,29.5 34.85,29.5 34.3,30.05
$1N120: length 1.9
  Top Layer w0.2: 5.22,30.7 5.22,32.58
$2N150: length 13.2
  Top Layer w0.2: 19.64,24.95 12.04,24.95 11.38,25.61 11.38,26.12 10.6,26.9 10.6,28.76 11.41,29.57
$2N151: length 5.6
  Top Layer w0.2: 38.31,40.87 38.77,40.87 40.4,42.49 42.06,42.49 42.74,43.17 42.74,43.4
$2N168: length 3.4
  Top Layer w0.15: 31.45,21.1 29.65,22.9
  Top Layer w0.2: 32.25,21.1 31.45,21.1 31.4,21.05
$2N201: length 1.2
  Top Layer w0.2: 27.35,37.25 27.35,36.05
$2N244: length 3.7
  Top Layer w0.2: 33,26.1 32.75,26.1 31.6,24.95 29.75,24.95
$2N245: length 5.4
  Top Layer w0.2: 33.22,27.63 32.28,27.63 31.95,27.3 31.95,26.05 31.25,25.35 29.46,25.35
$2N246: length 4.6
  Top Layer w0.2: 12.66,26.67 13.4,26.67 ; 13.4,26.67 15.15,26.67 ; 13.4,26.67 13.4,26.65 ; 13.4,26.67 13.4,28 13.35,28.05 12.91,28.05 12.71,28.25
$2N253: length 4.3
  Top Layer w0.127: U3.63 29.51,23.7 32.26,23.7
  Top Layer w0.25: 32.26,23.7 32.7,23.05 L2.2

## Copper pours and planes (outline as drawn; the poured copper is in the pictures)
+3V3 on VBAT_SIG: 5.85,39.86 5.75,40.4 5.44,40.89 1.16,45.23 0.63,45.96 0.35,46.76 0.3,47.33 0.35,47.84 0.63,48.64 1.13,49.33 1.86,49.87 2.66,50.15 3.51,50.18 4.54,49.87 5.27,49.34 9.61,45.06 10.05,44.77 10.38,44.67 38.46,44.65 39,44.75 39.49,45.06 43.83,49.34 44.56,49.87 45.59,50.18 46.44,50.15 47.24,49.87 47.93,49.37 48.47,48.64 48.75,47.84 48.8,47.33 48.75,46.76 48.47,45.96 47.94,45.23 43.66,40.89 43.37,40.45 43.27,40.12 43.26,20.85 41.05,20.85 41.05,17.95 5.83,17.95
GND on Top Layer: 0.35,50.15 48.75,50.15 48.75,0.35 0.35,0.35
GND on Bottom Layer: 0.35,50.15 48.75,50.15 48.75,0.35 0.35,0.35
GND on GND_L2: 2.66,0.35 1.81,0.66 1.34,0.98 0.94,1.38 0.63,1.86 0.43,2.33 0.32,2.89 0.31,3.46 0.51,4.28 0.94,5.02 5.42,9.59 5.73,10.05 5.83,10.38 5.83,16.32 4.13,18.05 4.13,34.15 5.83,35.88 5.85,39.86 5.75,40.4 5.44,40.89 1.16,45.23 0.63,45.96 0.35,46.76 0.3,47.33 0.35,47.84 0.63,48.64 1.13,49.33 1.86,49.87 2.66,50.15 3.51,50.18 4.54,49.87 5.27,49.34 9.61,45.06 10.05,44.77 10.38,44.67 33.59,44.65 35.16,46.21 40.66,46.21 43.83,49.34 44.56,49.87 45.59,50.18 46.44,50.15 47.24,49.87 47.93,49.37 48.47,48.64 48.75,47.84 48.8,47.33 48.75,46.76 48.47,45.96 47.94,45.23 43.66,40.89 43.37,40.45 43.27,40.12 43.25,10.64 43.35,10.1 43.66,9.61 47.94,5.27 48.47,4.54 48.75,3.74 48.8,3.23 48.75,2.66 48.47,1.86 47.97,1.17 47.24,0.63 46.44,0.35 45.93,0.3 45.36,0.35 44.56,0.63 43.83,1.16 39.49,5.44 39.05,5.73 38.72,5.83 10.64,5.85 10.1,5.75 9.61,5.44 4.83,0.81 4.33,0.53 3.79,0.36 3.23,0.3
VBAT on Top Layer: 39.2,12.85 39.2,15.15 40.4,15.15 40.4,16.05 43.25,16.05 43.25,12.85
VBAT on Top Layer: 16,6.15 16,16.25 32.45,16.25 32.45,15.5 35.33,15.5 35.33,13.98 32.8,11.45 32.8,6.15
VBAT on Top Layer: 5.95,12.7 5.95,15.9 8.85,15.9 8.85,15.47 11.81,15.47 11.81,12.7
VBAT on VBAT_SIG: 1.81,0.66 1.34,0.98 0.94,1.38 0.63,1.86 0.43,2.33 0.32,2.89 0.31,3.46 0.51,4.28 0.94,5.02 5.42,9.59 5.73,10.05 5.83,10.38 5.83,17.55 41.45,17.55 41.45,20.45 43.26,20.45 43.25,10.64 43.35,10.1 43.66,9.61 47.94,5.27 48.47,4.54 48.75,3.74 48.8,3.23 48.75,2.66 48.47,1.86 47.97,1.17 47.24,0.63 46.44,0.35 45.93,0.3 45.36,0.35 44.56,0.63 43.83,1.16 39.49,5.44 39.05,5.73 38.72,5.83 10.64,5.85 10.1,5.75 9.61,5.44 4.83,0.81 4.33,0.53 3.79,0.36 3.23,0.3 2.66,0.35

## Text on the board
Top Silkscreen Layer: RESET | START | PHASE SENSE | ENCODERS | SPI IMU | RP2350B | DUAL DRIVE | QUAD | CONTROL V1
